# EAGLE design AquisitionBoardV3 (EAGLE 9.6.2)
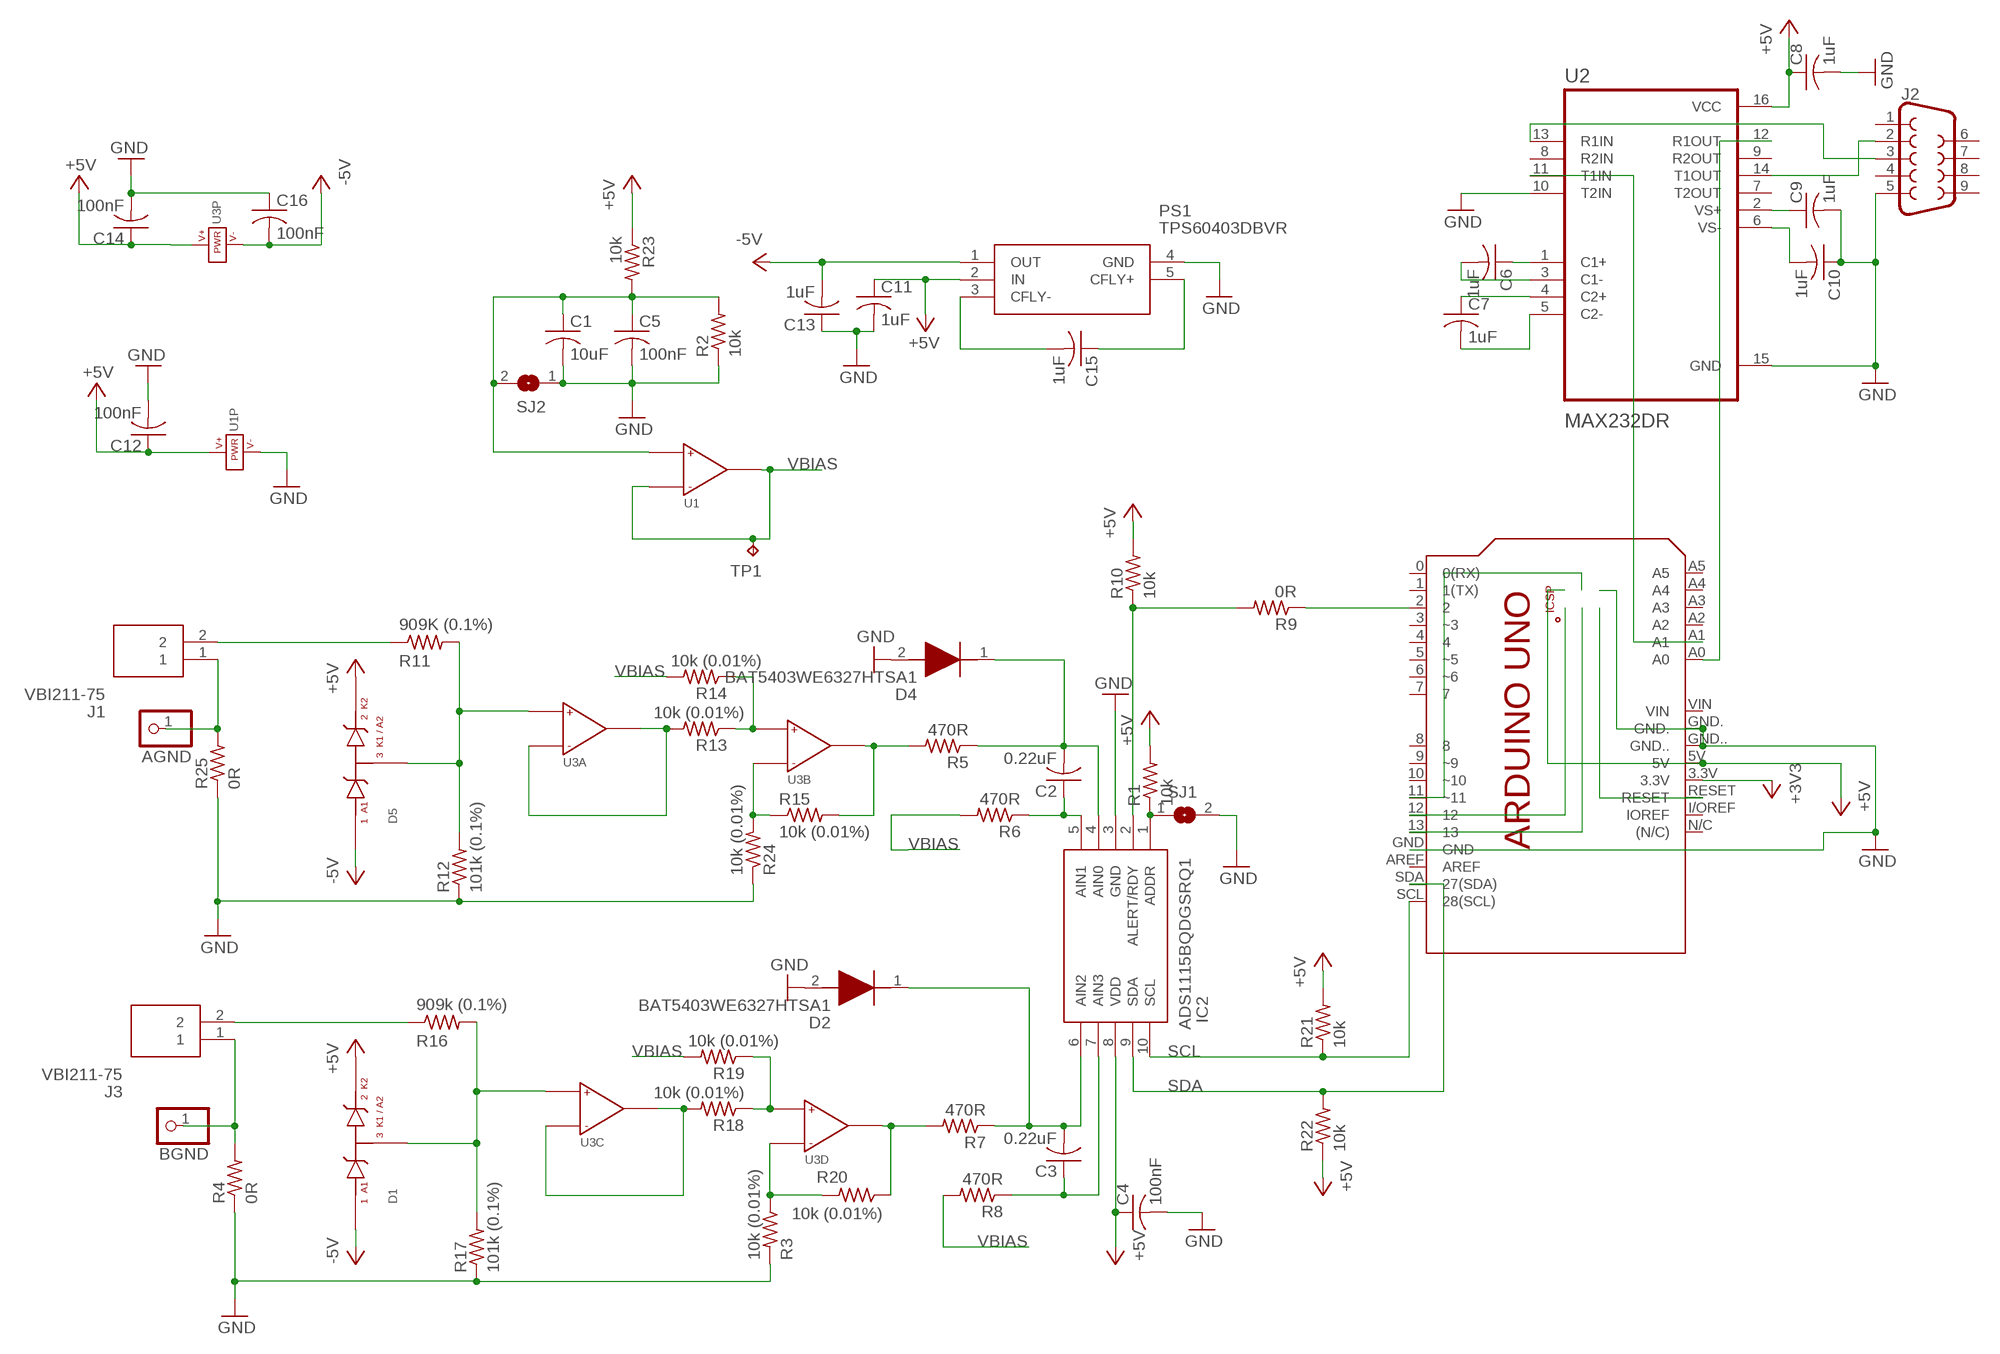
[diagram p0: schematic, sheet 1]

## Parts
AGND  PINHD-1X1  [1X01]
BGND  PINHD-1X1  [1X01]
C1  10uF  C-USC0603  [C0603]
C2  0.22uF  C-USC0603  [C0603]
C3  0.22uF  C-USC0603  [C0603]
C4  100nF  C-USC0603  [C0603]
C5  100nF  C-USC0603  [C0603]
C6  1uF  C-USC0603  [C0603]
C7  1uF  C-USC0603  [C0603]
C8  1uF  C-USC0603  [C0603]
C9  1uF  C-USC0603  [C0603]
C10  1uF  C-USC0603  [C0603]
C11  1uF  C-USC0603  [C0603]
C12  100nF  C-USC0603  [C0603]
C13  1uF  C-USC0603  [C0603]
C14  100nF  C-USC0603  [C0603]
C15  1uF  C-USC0603  [C0603]
C16  100nF  C-USC0603  [C0603]
D1  BAS70_04_SOT23COMMERCIAL_REELNXP  [SOT23-3_NEXPERIA]
D2  BAT5403WE6327HTSA1  [SOD2513X110N]
D4  BAT5403WE6327HTSA1  [SOD2513X110N]
D5  BAS70_04_SOT23COMMERCIAL_REELNXP  [SOT23-3_NEXPERIA]
IC2  ADS1115BQDGSRQ1  [SOP50P490X110-10N]
J1  VBI211-75  [VBI21175]
J2  DB9MALE  [DB9_MALE]
J3  VBI211-75  [VBI21175]
PCB1  ARDUINO_UNO  [ARDUINO_UNO]
PS1  TPS60403DBVR  [SOT95P280X145-5N]
R1  10k  R-US_R0805  [R0805]
R2  10k  R-US_R0805  [R0805]
R3  10k (0.01%)  R-US_R0805  [R0805]
R4  0R  R-US_R0805  [R0805]
R5  470R  R-US_R0805  [R0805]
R6  470R  R-US_R0805  [R0805]
R7  470R  R-US_R0805  [R0805]
R8  470R  R-US_R0805  [R0805]
R9  0R  R-US_R0805  [R0805]
R10  10k  R-US_R0805  [R0805]
R11  909K (0.1%)  R-US_R0805  [R0805]
R12  101k (0.1%)  R-US_R0805  [R0805]
R13  10k (0.01%)  R-US_R0805  [R0805]
R14  10k (0.01%)  R-US_R0805  [R0805]
R15  10k (0.01%)  R-US_R0805  [R0805]
R16  909k (0.1%)  R-US_R0805  [R0805]
R17  101k (0.1%)  R-US_R0805  [R0805]
R18  10k (0.01%)  R-US_R0805  [R0805]
R19  10k (0.01%)  R-US_R0805  [R0805]
R20  10k (0.01%)  R-US_R0805  [R0805]
R21  10k  R-US_R0805  [R0805]
R22  10k  R-US_R0805  [R0805]
R23  10k  R-US_R0805  [R0805]
R24  10k (0.01%)  R-US_R0805  [R0805]
R25  0R  R-US_R0805  [R0805]
SJ1  SJ  [SJ]
SJ2  SJ  [SJ]
TP1  TPB1,27  [B1,27]
U1  LMV321ARIDBV  [TI-DBV0005A-SOT23-5]
U2  MAX232DR  [SOIC127P600X175-16N]
U3  OPA4192  [SOIC14]

## Nets
+3V3: PCB1.3.3V
+5V: C4.1 C8.1 C11.1 C12.1 C14.1 D1.2(K2) D5.2(K2) IC2.8(VDD) PCB1.5V PCB1.+5V PS1.2(IN) R1.2 R10.2 R21.2 R22.1 R23.1 U1.5(V+) U2.16(VCC) U3.4(P:V+)
-5V: C13.2 C16.2 D1.1(A1) D5.1(A1) PS1.1(OUT) U3.11(P:V-)
GND: C1.2 C4.2 C5.2 C8.2 C9.2 C10.1 C11.2 C12.2 C13.1 C14.2 C16.1 D2.2(A) D4.2(A) IC2.3(GND) J2.5 PCB1.GND PCB1.GND. PCB1.GND.. PCB1.GND_ PS1.4(GND) R2.1 R3.2 R4.1 R12.1 R17.1 R24.1 R25.1 SJ1.2 SJ2.1 U1.2(V-) U2.10(T2IN) U2.15(GND)
N$1: J1.2 R11.1
N$2: R13.1 R14.1 U3.5(B:+IN)
N$3: R15.1 R24.2 U3.6(B:-IN)
N$4: PCB1.RESET PCB1.RESET.
N$5: PCB1.13 PCB1.SCK
N$6: R5.2 R15.2 U3.7(B:OUT)
N$7: BGND.1 J3.1 R4.2
N$8: R7.2 R20.1 U3.14(D:OUT)
N$9: IC2.1(ADDR) R1.1 SJ1.1
N$10: C1.1 C5.1 R2.2 R23.2 SJ2.2 U1.3(+IN)
N$11: R3.1 R20.2 U3.13(D:-IN)
N$12: D5.3(K1_A2) R11.2 R12.2 U3.3(A:+IN)
N$13: AGND.1 J1.1 R25.2
N$14: D1.3(K1_A2) R16.2 R17.2 U3.10(C:+IN)
N$15: C2.2 D4.1(K) IC2.4(AIN0) R5.1
N$16: PCB1.12 PCB1.MISO
N$17: PCB1.11(~11) PCB1.MOSI
N$18: C2.1 IC2.5(AIN1) R6.1
N$19: C3.2 D2.1(K) IC2.6(AIN2) R7.1
N$20: J2.3 U2.13(R1IN)
N$21: R13.2 U3.1(A:OUT) U3.2(A:-IN)
N$22: C3.1 IC2.7(AIN3) R8.1
N$23: IC2.2(ALERT/RDY) R9.2 R10.1
N$24: PCB1.2 R9.1
N$25: J2.2 U2.14(T1OUT)
N$26: J3.2 R16.1
N$27: C15.2 PS1.3(CFLY-)
N$28: C15.1 PS1.5(CFLY+)
N$29: C6.1 U2.1(C1+)
N$30: C6.2 U2.3(C1-)
N$31: C7.1 U2.4(C2+)
N$32: C7.2 U2.5(C2-)
N$33: C9.1 U2.2(VS+)
N$34: C10.2 U2.6(VS-)
N$35: R18.2 U3.8(C:OUT) U3.9(C:-IN)
N$36: R18.1 R19.1 U3.12(D:+IN)
N$39: PCB1.A0 U2.12(R1OUT)
N$40: PCB1.A1 U2.11(T1IN)
SCL: IC2.10(SCL) PCB1.SCL(28(SCL)) R21.1
SDA: IC2.9(SDA) PCB1.SDA(27(SDA)) R22.2
VBIAS: R6.2 R8.2 R14.2 R19.2 TP1.TP U1.1(OUT) U1.4(-IN)
Unconnected: J2.1 J2.4 J2.6 J2.7 J2.8 J2.9 PCB1.0(0(RX)) PCB1.1(1(TX)) PCB1.3(~3) PCB1.4 PCB1.5(~5) PCB1.6(~6) PCB1.7 PCB1.8 PCB1.9(~9) PCB1.10(~10) PCB1.A2 PCB1.A3 PCB1.A4 PCB1.A5 PCB1.AREF PCB1.I/OREF(IOREF) PCB1.N/C((N/C)) PCB1.VIN U2.7(T2OUT) U2.8(R2IN) U2.9(R2OUT)

## Library data of the parts
AGND BGND = pinhead:PINHD-1X1: PIN HEADER
C1-C16 = rcl:C-US: CAPACITOR, American symbol; SPICEPREFIX: C
D1 D5 = BAS70-04_SOT23:BAS70_04_SOT23: BAS70-04 dual-series Schottky diode Nexperia SOT23 (TO-236AB). Pin 1 = A1, pin 3 = K1/A2 series junction, pin 2 = K2. The symbol displays both physical diodes and all three pin numbers.; CONFIGURATION: DUAL SERIES; I_F: 70 mA; MANUFACTURER: Nexperia; MOUSER: 771-BAS70-04-T/R; MPN: BAS70-04,215; PACKAGE: SOT23 (TO-236AB); V_R: 70 V
D2 D4 = BAT5403WE6327HTSA1:BAT5403WE6327HTSA1: Schottky Diodes & Rectifiers Silicon Schottky Diode Source: Datasheet <https://4donline.ihs.com/images/VipMasterIC/IC/INFN/INFNS15399/INFNS15399-1.pdf?hkey=6D3A4C79FDBF58556ACFDE234799DDF0>; DESCRIPTION: Schottky Diodes & Rectifiers Silicon Schottky Diode; HEIGHT: 1.1mm; MANUFACTURER_NAME: Infineon; MANUFACTURER_PART_NUMBER: BAT5403WE6327HTSA1; MOUSER_PART_NUMBER: 726-BAT5403WE6327HTS; MOUSER_PRICE-STOCK: https://www.mouser.co.uk/ProductDetail/Infineon-Technologies/BAT5403WE6327HTSA1?qs=K00xGehIljvI6S4eikNcww%3D%3D
IC2 = ADS1115BQDGSRQ1:ADS1115BQDGSRQ1: Automotive 16-Bit 860SPS 4-Ch Delta-Sigma ADC With PGA, Oscillator, VREF, Comparator, and I2C Source: Datasheet <http://www.ti.com/lit/gpn/ads1115-q1>; DESCRIPTION: Automotive 16-Bit 860SPS 4-Ch Delta-Sigma ADC With PGA, Oscillator, VREF, Comparator, and I2C; HEIGHT: 1.1mm; MANUFACTURER_NAME: Texas Instruments; MANUFACTURER_PART_NUMBER: ADS1115BQDGSRQ1; MOUSER_PART_NUMBER: 595-ADS1115BQDGSRQ1; MOUSER_PRICE-STOCK: https://www.mouser.co.uk/ProductDetail/Texas-Instruments/ADS1115BQDGSRQ1?qs=34RfhUjJmKdvyLrkbnfjHA%3D%3D
J1 J3 = VBI211-75:VBI211-75: RF Connectors / Coaxial Connectors BNC R/A PCB Mt Jack Source: Datasheet <https://www.mouser.mx/datasheet/2/643/dr-CCS-VIT-VBI211-75-1308996.pdf>; DESCRIPTION: RF Connectors / Coaxial Connectors BNC R/A PCB Mt Jack; HEIGHT: 13mm; MANUFACTURER_NAME: Cinch Connectivity Solutions; MANUFACTURER_PART_NUMBER: VBI211-75; MOUSER_PART_NUMBER: 530-VBI211-75; MOUSER_PRICE-STOCK: https://www.mouser.co.uk/ProductDetail/Vitelec-Cinch-Connectivity-Solutions/VBI211-75?qs=HAjLtCtd%252Bdatcts%2FKc37yQ%3D%3D
J2 = SparkFun-Connectors:DB9: DB9 Connector Standard DB9 (D-Sub 9) serial connector. Can be used for CAN bus as well as RS485 and RS232. Footprint production proven. Here is the female version connector we sell at SparkFun: 9 Pin Female Serial Connector - PCB Mount <https://www.sparkfun.com/products/429> (PRT-00429) This connector has been used on the following SparkFun products: SparkFun RS232 Shifter - SMD <https://www.sparkfun.com/products/449> (PRT-00449) SparkFun RS232 Shifter SMD (No DB9) <https://www.sparkfun.com/products/8780> (PRT-08780); PROD_ID: CONN-09904
PCB1 = E14_Arduino_revC:ARDUINO_UNO: Device for representing an Arduino Uno board with a footprint in an EAGLE design. Created by Dave Young for Element14. More EAGLE documentation at: http://www.element14.com/community/community/knode/cadsoft_eagle
PS1 = TPS60403DBVR:TPS60403DBVR: 60mA Charge Pump Voltage Inverter with Fixed 250kHz Operation Source: Datasheet <http://www.ti.com/lit/gpn/tps60403>; DESCRIPTION: 60mA Charge Pump Voltage Inverter with Fixed 250kHz Operation; HEIGHT: 1.45mm; MANUFACTURER_NAME: Texas Instruments; MANUFACTURER_PART_NUMBER: TPS60403DBVR; MOUSER_PART_NUMBER: 595-TPS60403DBVR; MOUSER_PRICE-STOCK: https://www.mouser.co.uk/ProductDetail/Texas-Instruments/TPS60403DBVR?qs=Gse6rAGbi78QziU1WFApxQ%3D%3D
R1-R25 = rcl:R-US_: RESISTOR, American symbol; SPICEPREFIX: R
SJ1 SJ2 = jumper:SJ: SMD solder JUMPER
TP1 = testpad:TP: Test pad
U1 = LMV3xxA:LMV321A: LMV321A single op amp DBV uses the standard pinout; DCK uses the alternate five-pin pinout shown in SBOS923I. Invoke P for power.; MPN: LMV321AIDBVR; PACKING: LARGE T&R
U2 = MAX232DR:MAX232DR
U3 = OPA4192:OPA4192: OPA4192 quad op amp, SOIC-14 ADD places A. INVOKE B, C, D, and P as needed.; MANUFACTURER: Texas Instruments; MPN: OPA4192ID

## Board
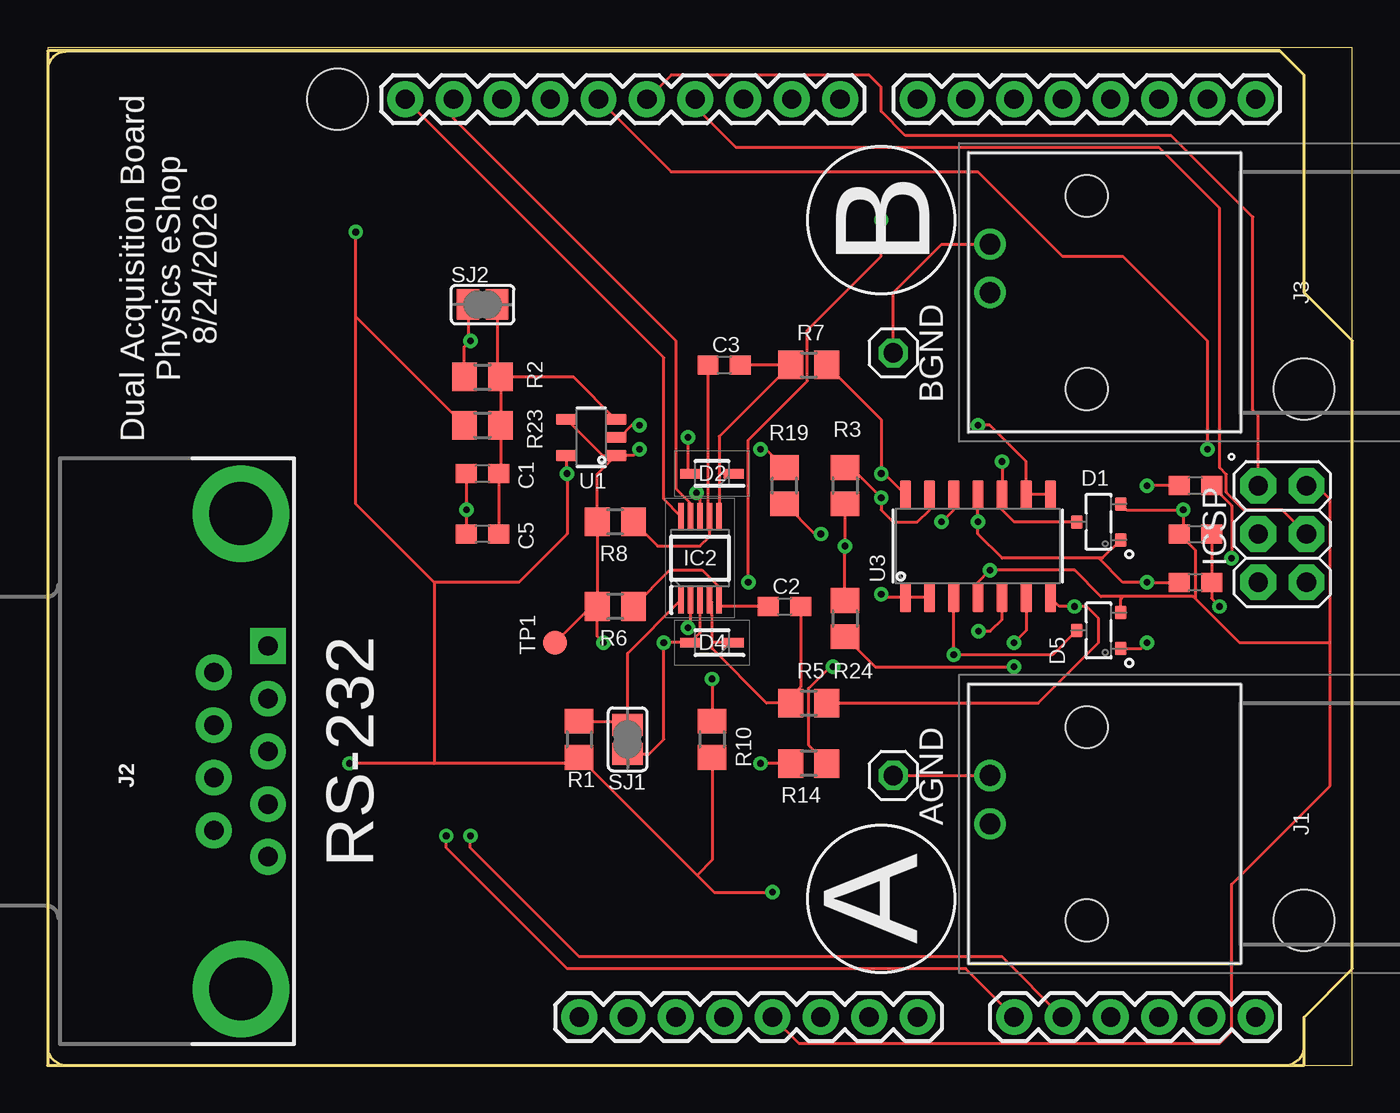
[diagram p1: board, top side]
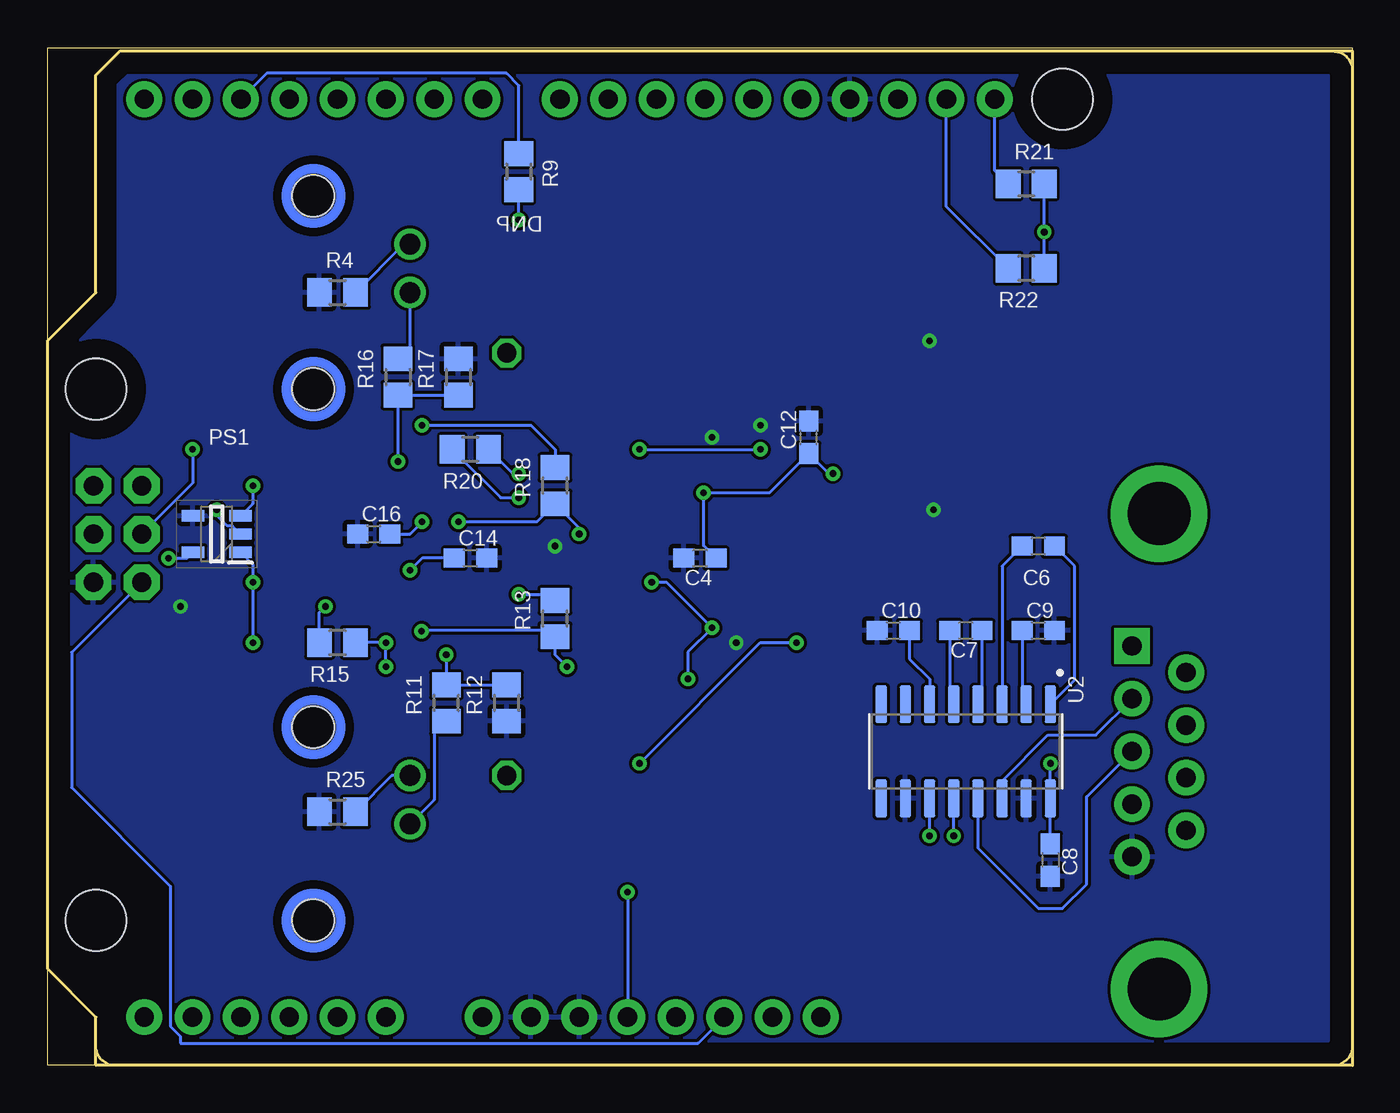
[diagram p2: board, bottom side, seen from below]

Size 68.58 x 53.52 mm. Coordinates in mm from the lower left corner, seen from the top.
Outline: 0,0 68.56,0 68.56,53.52 0,53.52 0,0
Outline: 0,0 66.04,0 66.04,2.54 68.58,5.08 68.58,38.1 66.04,40.64 66.04,52.07 64.77,53.34 0,53.34 0,0
Copper layers (1*16): Top 0.035mm / dielectric 1.5mm / Bottom 0.035mm
Design rules "default *": minimum track width 6mil, minimum drill 0.35mm, track to track 6mil, track to pad 6mil, pad to pad 6mil, via to via 6mil, smd to smd 6mil, copper to edge 40mil, drill to drill 6mil, minimum pad ring 10mil, minimum via ring 8mil, stop-mask expansion 4mil, vias tented up to drill 14mil, thermal gap 10mil

### Footprints (pad centres in the part's own frame; a part is rotated, then mirrored left to right if it is on the bottom)
1X01 = drill 1.016 octagon: 1 0,0
C0603 = smd 1.1 x 1: 1 -0.85,0; 2 0.85,0
SOT23-3_NEXPERIA = smd 0.7 x 0.6: 1 -0.95,-1.15; 2 0.95,-1.15; 3 0,1.15
SOD2513X110N = smd 1.05 x 0.5: 1 -1.138,0; 2 1.138,0
SOP50P490X110-10N = smd 1.4 x 0.3: 1 -2.2,1; 2 -2.2,0.5; 3 -2.2,0; 4 -2.2,-0.5; 5 -2.2,-1; 6 2.2,-1; 7 2.2,-0.5; 8 2.2,0; 9 2.2,0.5; 10 2.2,1
VBI21175 = drill 1.1 pad 1.65: 1 0,0; 2 2.54,0 | hole 2.2: -2.54,5.08; 7.62,5.08
DB9_MALE = drill 1.016 pad 1.88 square: 1 5.54,-1.42 | drill 1.016 pad 1.88: 2 2.77,-1.42; 3 0,-1.42; 4 -2.77,-1.42; 5 -5.54,-1.42; 6 4.15,1.42; 7 1.38,1.42; 8 -1.38,1.42; 9 -4.15,1.42 | drill 3.302 pad 5.08: G1 -12.5,0; G2 12.5,0
ARDUINO_UNO = drill 1.016 pad 1.88: 0 63.5,50.8; 1 60.96,50.8; 2 58.42,50.8; 3 55.88,50.8; 3.3V 35.56,2.54; 4 53.34,50.8; 5 50.8,50.8; 5V 38.1,2.54; 6 48.26,50.8; 7 45.72,50.8; 8 41.656,50.8; 9 39.116,50.8; 10 36.576,50.8; 11 34.036,50.8; 12 31.496,50.8; 13 28.956,50.8; A0 50.8,2.54; A1 53.34,2.54; A2 55.88,2.54; A3 58.42,2.54; A4 60.96,2.54; A5 63.5,2.54; AREF 23.876,50.8; GND 26.416,50.8; GND. 43.18,2.54; GND.. 40.64,2.54; I/OREF 30.48,2.54; N/C 27.94,2.54; RESET 33.02,2.54; SCL 18.796,50.8; SDA 21.336,50.8; VIN 45.72,2.54 | drill 1.016 pad 1.88 octagon: +5V 66.167,30.48; GND_ 66.167,25.4; MISO 63.627,30.48; MOSI 66.167,27.94; RESET. 63.627,25.4; SCK 63.627,27.94 | hole 3.2: 66.04,7.62; 66.04,35.56; 15.24,50.8
SOT95P280X145-5N = smd 1.2 x 0.6: 1 -1.25,0.95; 2 -1.25,0; 3 -1.25,-0.95; 4 1.25,-0.95; 5 1.25,0.95
R0805 = smd 1.3 x 1.5: 1 -0.95,0; 2 0.95,0
SJ = smd 1.168 x 1.6: 1 -0.762,0; 2 0.762,0
B1,27 = smd 1.27 x 1.27: TP 0,0
TI-DBV0005A-SOT23-5 = smd 1.1 x 0.6: 1 -1.3,0.95; 2 -1.3,0; 3 -1.3,-0.95; 4 1.3,-0.95; 5 1.3,0.95
SOIC127P600X175-16N = smd 1.97 x 0.6: 1 -2.475,4.445; 2 -2.475,3.175; 3 -2.475,1.905; 4 -2.475,0.635; 5 -2.475,-0.635; 6 -2.475,-1.905; 7 -2.475,-3.175; 8 -2.475,-4.445; 9 2.475,-4.445; 10 2.475,-3.175; 11 2.475,-1.905; 12 2.475,-0.635; 13 2.475,0.635; 14 2.475,1.905; 15 2.475,3.175; 16 2.475,4.445
SOIC14 = smd 1.55 x 0.6: 1 -2.7,3.81; 2 -2.7,2.54; 3 -2.7,1.27; 4 -2.7,0; 5 -2.7,-1.27; 6 -2.7,-2.54; 7 -2.7,-3.81; 8 2.7,-3.81; 9 2.7,-2.54; 10 2.7,-1.27; 11 2.7,0; 12 2.7,1.27; 13 2.7,2.54; 14 2.7,3.81

### Placement (x,y rotation side)
AGND  44.45,15.24 0 top
BGND  44.45,37.47 0 top
C1  22.86,31.11 180 top
C2  38.73,24.13 0 top
C3  35.56,36.83 0 top
C4  34.29,26.67 180 bottom
C5  22.86,27.94 180 top
C6  16.51,27.3 180 bottom
C7  20.32,22.86 180 bottom
C8  15.88,10.79 270 bottom
C9  16.51,22.86 0 bottom
C10  24.13,22.86 0 bottom
C11  60.33,27.94 0 top
C12  28.57,33.02 90 bottom
C13  60.33,25.4 180 top
C14  46.35,26.67 0 bottom
C15  60.33,30.48 180 top
C16  51.44,27.94 0 bottom
D1  55.24,28.57 90 top
D2  34.92,31.11 180 top
D4  34.92,22.23 180 top
D5  55.24,22.86 90 top
IC2  34.29,26.67 90 top
J1  49.53,15.24 270 top
J2  10.16,16.51 90 top
J3  49.53,43.18 270 top
PCB1  0,0 0 top
PS1  59.69,27.94 180 bottom
R1  27.94,17.14 270 top
R2  22.86,36.2 0 top
R3  41.91,30.48 270 top
R4  53.34,40.64 0 bottom
R5  40.01,19.05 0 top
R6  29.84,24.13 180 top
R7  40.01,36.83 0 top
R8  29.84,28.57 180 top
R9  43.81,46.99 270 bottom
R10  34.92,17.14 270 top
R11  47.62,19.05 90 bottom
R12  44.45,19.05 90 bottom
R13  41.91,23.5 90 bottom
R14  40.01,15.88 180 top
R15  53.34,22.23 180 bottom
R16  50.16,36.2 270 bottom
R17  46.99,36.2 270 bottom
R18  41.91,30.48 90 bottom
R19  38.73,30.48 90 top
R20  46.35,32.38 180 bottom
R21  17.14,46.35 0 bottom
R22  17.14,41.91 180 bottom
R23  22.86,33.66 0 top
R24  41.91,23.5 270 top
R25  53.34,13.34 0 bottom
SJ1  30.48,17.14 270 top
SJ2  22.86,40.01 0 top
TP1  26.67,22.23 0 top
U1  28.57,33.02 180 top
U2  20.32,16.51 270 bottom
U3  48.9,27.3 90 top

### Tracks (layer width: path | path; a pad name or v marks a point on that pad's centre or on a via)
+5V  (via drill 0.35)
  Top 0.152: PCB1.5V 39.47,1.17 61.59,1.17 62.23,1.8 62.23,9.53 67.41,14.71 67.41,22.23 | PCB1.+5V 66.67,30.48 67.41,29.74 67.41,22.23 | 60.33,24.54 62.64,22.23 67.41,22.23 | 60.33,24.54 60.21,24.65 56.52,24.65 | 60.33,24.54 60.33,27.09 C11.1 59.69,28.16 v59.69,29.21 56.71,29.21 D1.2 | U3.4 48.9,25.4 v49.53,26.04 53.98,26.04 55.36,24.65 56.52,24.65 | D5.2 56.4,24.53 56.52,24.65 | v34.1,30.1 34.29,29.91 IC2.8 | 20.32,15.88 27.62,15.88 R1.2 34.13,10 | 20.32,15.88 v15.88,15.88 | R23.1 16.2,39.37 | 16.2,39.37 v16.2,43.81 | v38.1,9.11 35.03,9.11 34.13,10 | U1.5 27.27,31.14 v27.3,31.11 27.3,27.94 24.77,25.4 20.32,25.4 | 20.32,25.4 16.2,29.52 16.2,39.37 | 20.32,25.4 20.32,15.88 | R10.2 34.92,10.79 34.13,10
  Bottom 0.152: PS1.2 58.86,28.36 59.13,28.36 59.69,28.92 v59.69,29.21 | C14.1 48.9,26.67 v49.53,26.04 | C4.1 34.1,27.33 v34.1,30.1 30.64,30.1 C12.1 27.52,31.11 v27.3,31.11 | R22.1 v16.2,43.81 R21.2 | C8.1 U2.16 v15.88,15.88 | v38.1,9.11 PCB1.5V
-5V  (via drill 0.35)
  Top 0.152: C13.2 v57.78,25.4 56.52,25.4 55.24,26.67 | U3.11 v48.9,28.57 48.9,27.94 50.16,26.67 55.24,26.67 | 55.24,26.67 55.44,26.67 D1.1 | D5.1 57.47,21.91 v57.78,22.23
  Bottom 0.152: PS1.1 57.78,26.34 v57.78,25.4 v57.78,22.23 | C16.2 49.53,27.94 v48.9,28.57
GND  (via drill 0.35)
  Top 0.152: C11.2 C13.1 61.17,24.55 v61.59,24.13 | R3.2 v41.91,27.3 R24.1 | D2.2 33.66,31.25 v33.66,33.02 | IC2.3 34.29,22.73 D4.2 v32.38,22.23 32.38,17.14 31.62,16.38 SJ1.2 | C1.2 v22.01,29.21 C5.2 | R2.1 21.91,37.78 v22.23,38.1 22.1,38.23 SJ2.1 | U1.2 30.07,33.02 30.71,33.66 v31.11,33.66
  pour Bottom: 1.27,1.27 67.31,1.27 67.31,52.07 1.27,52.07
N$1
  Bottom 0.152: R11.1 48.26,17.46 48.26,13.97 J1.2
N$2  (via drill 0.35)
  Top 0.152: v48.92,22.83 49.56,22.83 50.16,23.44 U3.5 | R14.1 40.01,16.82 40.01,19.82 41.14,20.95 v41.27,20.95
  Bottom 0.152: v48.92,22.83 48.9,22.86 42.23,22.86 R13.1 41.91,21.59 v41.27,20.95
N$3  (via drill 0.35)
  Top 0.152: U3.6 51.44,22.86 v50.8,22.23 | R24.2 43.5,20.95 v50.8,20.95
  Bottom 0.152: R15.1 v50.8,22.23 v50.8,20.95
N$4
  Bottom 0.152: PCB1.RESET. 67.31,21.72 67.31,14.61 62.13,9.42 62.13,2.06 61.59,1.52 61.59,1.17 34.39,1.17 PCB1.RESET
N$5  (via drill 0.35)
  Top 0.152: PCB1.13 32.77,46.99 48.9,46.99 53.34,42.55 56.52,42.55 60.96,38.1 v60.96,32.38
  Bottom 0.152: v60.96,32.38 60.96,30.61 PCB1.SCK
N$6  (via drill 0.35)
  Top 0.152: U3.7 53.18,24.13 v53.98,24.13 54.61,24.13 55.24,23.5 55.24,22.23 52.07,19.05 R5.2
  Bottom 0.152: R15.2 54.29,23.82 v53.98,24.13
N$7
  Top 0.152: BGND.1 44.45,40.64 46.99,43.18 J3.1
  Bottom 0.152: R4.2 49.85,43.18 J3.1
N$8  (via drill 0.35)
  Top 0.152: U3.14 43.98,31.11 v43.81,31.11 43.81,33.97 R7.2
  Bottom 0.152: R20.1 44.13,31.11 v43.81,31.11
N$9
  Top 0.152: IC2.1 30.48,21.66 SJ1.1 30.29,18.09 R1.1
N$10
  Top 0.152: C5.1 C1.1 23.81,31.21 R23.2 R2.2 | SJ2.2 23.62,36.38 R2.2 | U1.3 27.65,36.2 R2.2
N$11  (via drill 0.35)
  Top 0.152: U3.13 46.35,29.21 45.72,28.57 44.45,28.57 43.81,29.21 v43.81,29.84 42.23,31.43 R3.1
  Bottom 0.152: R20.2 44.77,29.84 v43.81,29.84
N$12  (via drill 0.35)
  Top 0.152: U3.3 v47.62,21.59 52.83,21.59 D5.3
  Bottom 0.152: R12.2 R11.2 v47.62,21.59
N$13
  Top 0.152: AGND.1 J1.1
  Bottom 0.152: J1.1 50.48,15.24 R25.2
N$14  (via drill 0.35)
  Top 0.152: v50.16,31.75 U3.10 50.16,29.21 50.8,28.57 D1.3
  Bottom 0.152: R17.2 R16.2 v50.16,31.75
N$15
  Top 0.152: R5.1 38.73,19.05 | 38.73,19.05 37.78,19.05 34.92,21.91 34.92,22.23 | IC2.4 34.91,24.35 34.91,23.68 34.92,23.66 34.92,22.23 | C2.2 39.59,19.9 38.73,19.05 | D4.1 34.92,22.23
N$16
  Top 0.152: PCB1.MISO 63.63,34.17 63.35,34.45 63.35,44.6 59.05,48.9 45.09,48.9 43.81,50.16 43.81,51.44 43.18,52.07 32.77,52.07 PCB1.12
N$17
  Top 0.152: PCB1.MOSI 64.9,29.21 62.88,29.21 61.95,30.13 61.95,31.07 61.59,31.43 61.59,45.09 58.42,48.26 36.2,48.26 34.04,50.42 PCB1.11
N$18
  Top 0.152: C2.1 35.29,24.13 IC2.5 35.29,25.14 34.4,26.04 32.7,26.04 R6.1
N$19
  Top 0.152: 35.29,31.11 35.29,33.06 R7.1 C3.2 | 35.29,31.11 IC2.6 | D2.1 35.29,31.11
N$20
  Bottom 0.152: U2.13 19.68,11.43 16.51,8.26 15.24,8.26 13.97,9.53 13.97,14.12 J2.3
N$21  (via drill 0.35)
  Top 0.152: U3.2 U3.1 43.98,24.61 v43.81,24.77
  Bottom 0.152: v43.81,24.77 42.23,24.77 R13.2
N$22
  Top 0.152: C3.1 34.71,28.95 IC2.7 34.79,27.8 34.29,27.3 32.06,27.3 R8.1
N$23  (via drill 0.35)
  Top 0.152: IC2.2 33.79,23.14 v33.66,23.01 | v36.83,25.4 36.83,32.88 39.93,35.98 39.93,38.66 43.81,42.55 v43.81,44.45 | v34.92,20.32 R10.1
  Bottom 0.152: v36.83,25.4 36.05,25.4 v33.66,23.01 34.92,21.74 v34.92,20.32 | v43.81,44.45 R9.2
N$24
  Bottom 0.152: R9.1 43.81,51.52 44.45,52.16 57.06,52.16 PCB1.2
N$25
  Bottom 0.152: U2.14 18.41,14.96 16,17.38 13.48,17.38 J2.2
N$26
  Bottom 0.152: R16.1 49.53,37.78 J3.2
N$27  (via drill 0.35)
  Top 0.152: C15.2 v57.78,30.48
  Bottom 0.152: v57.78,30.48 57.8,30.46 57.8,29.52 PS1.3
N$28  (via drill 0.35)
  Top 0.152: C15.1 62.23,29.43 v62.23,26.67
  Bottom 0.152: v62.23,26.67 61.26,26.67 PS1.5
N$29
  Bottom 0.152: U2.1 14.61,20.25 14.61,26.25 C6.1
N$30
  Bottom 0.152: C6.2 18.41,26.25 U2.3
N$31
  Bottom 0.152: C7.1 19.47,19.2 U2.4
N$32
  Bottom 0.152: C7.2 21.17,19.2 U2.5
N$33
  Bottom 0.152: C9.1 17.36,19.2 U2.2
N$34
  Bottom 0.152: C10.2 23.28,21.38 22.23,20.32 U2.6
N$35  (via drill 0.35)
  Top 0.152: U3.8 U3.9 51.44,31.75 49.53,33.66 v48.9,33.66
  Bottom 0.152: v48.9,33.66 43.18,33.66 41.91,32.38 R18.2
N$36  (via drill 0.35)
  Top 0.152: v46.99,28.57 47.62,29.21 U3.12 | R19.1 40.33,27.94 v40.64,27.94
  Bottom 0.152: v46.99,28.57 42.87,28.57 R18.1 40.64,28.26 v40.64,27.94
N$39  (via drill 0.35)
  Top 0.152: PCB1.A0 48.26,5.08 27.3,5.08 20.95,11.43 v20.95,12.06
  Bottom 0.152: v20.95,12.06 U2.12
N$40  (via drill 0.35)
  Top 0.152: PCB1.A1 50.16,5.71 27.94,5.71 22.23,11.43 v22.23,12.06
  Bottom 0.152: v22.23,12.06 U2.11
SCL
  Top 0.152: IC2.10 32.38,29.77 32.38,37.21 PCB1.SCL
  Bottom 0.152: R21.1 18.8,47.06 PCB1.SCL
SDA
  Top 0.152: IC2.9 33.79,29.56 33.03,30.31 33.03,38.09 21.34,49.78 PCB1.SDA
  Bottom 0.152: R22.2 21.34,45.15 PCB1.SDA
VBIAS  (via drill 0.35)
  Top 0.152: R6.2 R8.2 28.89,31.09 U1.1 | U1.4 29.18,32.07 U1.1 | TP1.TP 28.57,24.13 R6.2 | R19.2 37.78,32.38 v37.47,32.38 | v31.11,32.38 30.8,32.07 U1.1 | R14.2 v37.47,15.88 | v29.21,22.23 28.89,22.54 R6.2
  Bottom 0.152: v37.47,32.38 v31.11,32.38 | v37.47,15.88 31.11,22.23 v29.21,22.23
(copper drawn outside any net)
  shapes: Bottom circle x4

### Text on the board
tPlace: B | Dual Acquisition Board / Physics eShop / 8/24/2026 | RS-232 | A
bPlace: DNP